# Altium schematic sheet ADC.SchDoc: ADC
size A4; DocumentNumber: 5; SheetNumber: 6; SheetTotal: 16
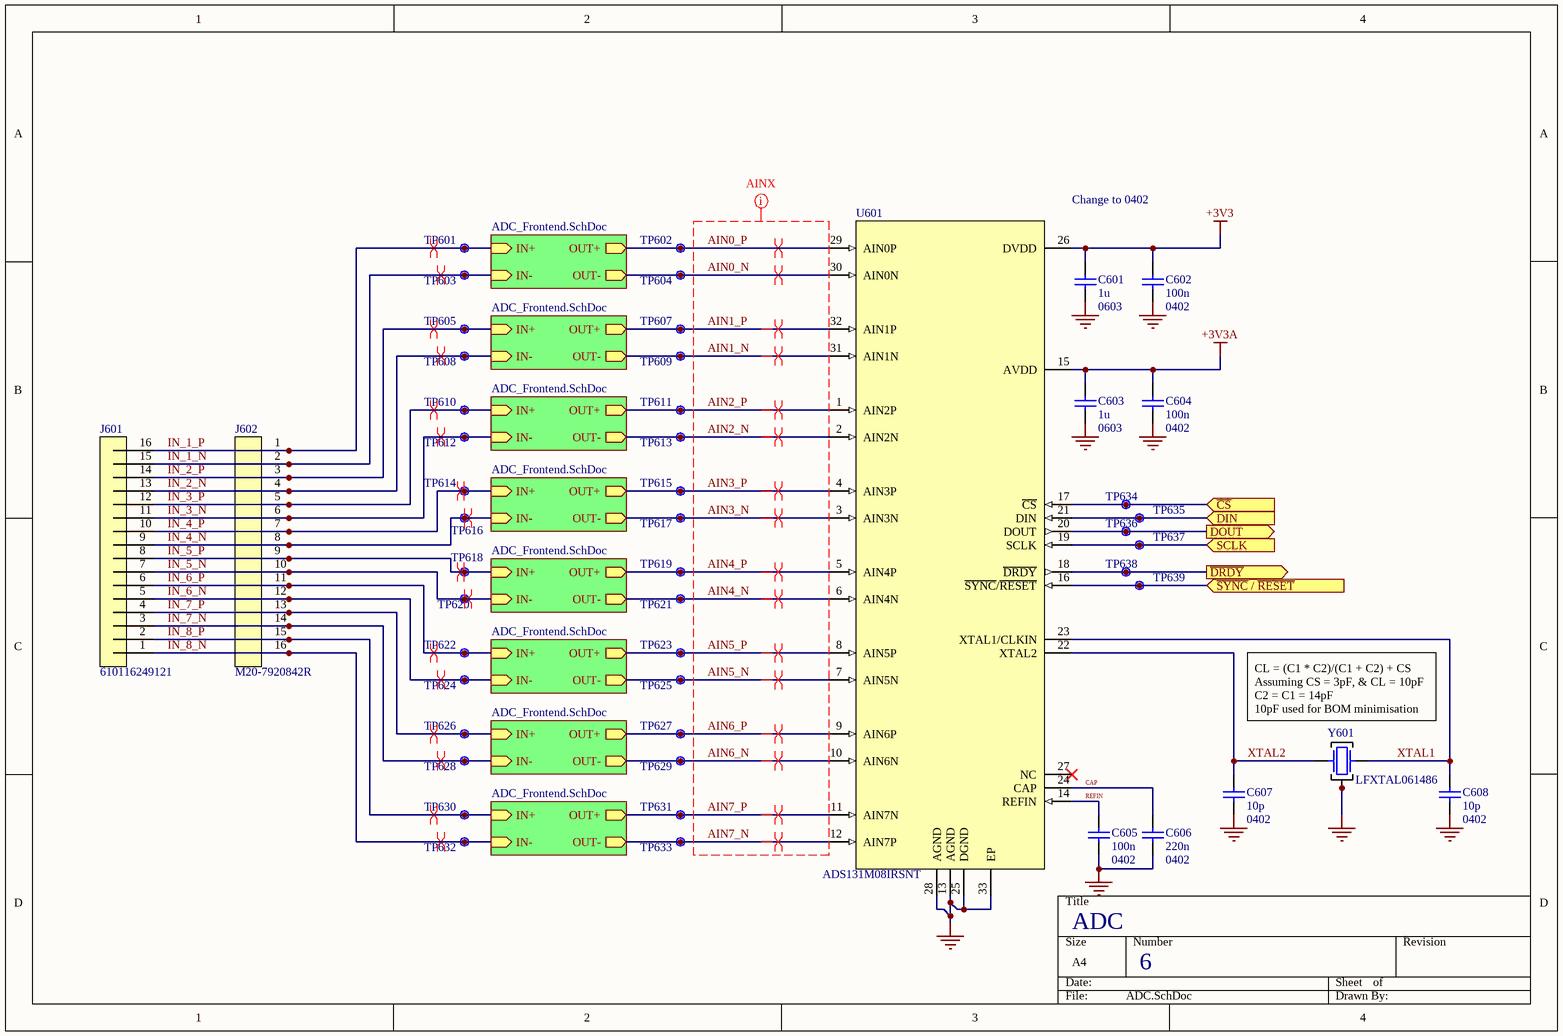
[diagram p0: ADC.SchDoc]

## Parts
C601  1u  Footprint: 0603  [CAP_0603_B]
C602  100n  Footprint: 0402  [CAP_0402_B]
C603  1u  Footprint: 0603  [CAP_0603_B]
C604  100n  Footprint: 0402  [CAP_0402_B]
C605  100n  Footprint: 0402  [CAP_0402_B]
C606  220n  Footprint: 0402  [CAP_0402_B]
C607  10p  Footprint: 0402  [CAP_0402_B]
C608  10p  Footprint: 0402  [CAP_0402_B]
J601  610116249121  [610116249121]
J602  M20-7920842R  [M20-7920842R]
TP601  Net  [Unlabelled Testpoint]  (value not drawn)
TP602  Net  [Unlabelled Testpoint]  (value not drawn)
TP603  Net  [Unlabelled Testpoint]  (value not drawn)
TP604  Net  [Unlabelled Testpoint]  (value not drawn)
TP605  Net  [Unlabelled Testpoint]  (value not drawn)
TP607  Net  [Unlabelled Testpoint]  (value not drawn)
TP608  Net  [Unlabelled Testpoint]  (value not drawn)
TP609  Net  [Unlabelled Testpoint]  (value not drawn)
TP610  Net  [Unlabelled Testpoint]  (value not drawn)
TP611  Net  [Unlabelled Testpoint]  (value not drawn)
TP612  Net  [Unlabelled Testpoint]  (value not drawn)
TP613  Net  [Unlabelled Testpoint]  (value not drawn)
TP614  Net  [Unlabelled Testpoint]  (value not drawn)
TP615  Net  [Unlabelled Testpoint]  (value not drawn)
TP616  Net  [Unlabelled Testpoint]  (value not drawn)
TP617  Net  [Unlabelled Testpoint]  (value not drawn)
TP618  Net  [Unlabelled Testpoint]  (value not drawn)
TP619  Net  [Unlabelled Testpoint]  (value not drawn)
TP620  Net  [Unlabelled Testpoint]  (value not drawn)
TP621  Net  [Unlabelled Testpoint]  (value not drawn)
TP622  Net  [Unlabelled Testpoint]  (value not drawn)
TP623  Net  [Unlabelled Testpoint]  (value not drawn)
TP624  Net  [Unlabelled Testpoint]  (value not drawn)
TP625  Net  [Unlabelled Testpoint]  (value not drawn)
TP626  Net  [Unlabelled Testpoint]  (value not drawn)
TP627  Net  [Unlabelled Testpoint]  (value not drawn)
TP628  Net  [Unlabelled Testpoint]  (value not drawn)
TP629  Net  [Unlabelled Testpoint]  (value not drawn)
TP630  Net  [Unlabelled Testpoint]  (value not drawn)
TP631  Net  [Unlabelled Testpoint]  (value not drawn)
TP632  Net  [Unlabelled Testpoint]  (value not drawn)
TP633  Net  [Unlabelled Testpoint]  (value not drawn)
TP634  Net  [Unlabelled Testpoint]  (value not drawn)
TP635  Net  [Unlabelled Testpoint]  (value not drawn)
TP636  Net  [Unlabelled Testpoint]  (value not drawn)
TP637  Net  [Unlabelled Testpoint]  (value not drawn)
TP638  Net  [Unlabelled Testpoint]  (value not drawn)
TP639  Net  [Unlabelled Testpoint]  (value not drawn)
U601  ADS131M08IRSNT  [ADS131M08IRSNT]
Y601  LFXTAL061486  [LFXTAL061486]

## Sub-sheets
ADC_Frontend = ADC_Frontend.SchDoc: IN+ (in), OUT+ (out), OUT- (out), IN- (in)
ADC_Frontend = ADC_Frontend.SchDoc: IN+ (in), OUT+ (out), OUT- (out), IN- (in)
ADC_Frontend = ADC_Frontend.SchDoc: IN+ (in), OUT+ (out), OUT- (out), IN- (in)
ADC_Frontend = ADC_Frontend.SchDoc: IN+ (in), OUT+ (out), OUT- (out), IN- (in)
ADC_Frontend = ADC_Frontend.SchDoc: IN+ (in), OUT+ (out), OUT- (out), IN- (in)
ADC_Frontend = ADC_Frontend.SchDoc: IN+ (in), OUT+ (out), OUT- (out), IN- (in)
ADC_Frontend = ADC_Frontend.SchDoc: IN+ (in), OUT+ (out), OUT- (out), IN- (in)
CH0 = ADC_Frontend.SchDoc: IN+ (in), OUT+ (out), OUT- (out), IN- (in)

## Ports
DIN (in, see Top_Level[2C]), DOUT (out, see Top_Level[2C]), SCLK (in, see Top_Level[2C]), ~{CS} (in, see Top_Level[2C]), ~{DRDY} (out, see Top_Level[2C]), ~{SYNC} / ~{RESET} (in, see Top_Level[2C])

## Nets
+3V3: C601.1 C602.1 U601.26(DVDD)
+3V3A: C603.1 C604.1 U601.15(AVDD)
GND: C601.2 C602.2 C603.2 C604.2 C605.2 C606.2 C607.2 C608.2 U601.13(AGND) U601.25(DGND) U601.28(AGND) U601.33(EP) Y601.2(GND) Y601.4(GND)
AIN0_N: TP604.1 U601.30(AIN0N) ; sheet CH0/OUT-
AIN0_P: TP602.1 U601.29(AIN0P) ; sheet CH0/OUT+
AIN1_N: TP609.1 U601.31(AIN1N) ; sheet ADC_Frontend/OUT-
AIN1_P: TP607.1 U601.32(AIN1P) ; sheet ADC_Frontend/OUT+
AIN2_N: TP613.1 U601.2(AIN2N) ; sheet ADC_Frontend/OUT-
AIN2_P: TP611.1 U601.1(AIN2P) ; sheet ADC_Frontend/OUT+
AIN3_N: TP617.1 U601.3(AIN3N) ; sheet ADC_Frontend/OUT-
AIN3_P: TP615.1 U601.4(AIN3P) ; sheet ADC_Frontend/OUT+
AIN4_N: TP621.1 U601.6(AIN4N) ; sheet ADC_Frontend/OUT-
AIN4_P: TP619.1 U601.5(AIN4P) ; sheet ADC_Frontend/OUT+
AIN5_N: TP625.1 U601.7(AIN5N) ; sheet ADC_Frontend/OUT-
AIN5_P: TP623.1 U601.8(AIN5P) ; sheet ADC_Frontend/OUT+
AIN6_N: TP629.1 U601.10(AIN6N) ; sheet ADC_Frontend/OUT-
AIN6_P: TP627.1 U601.9(AIN6P) ; sheet ADC_Frontend/OUT+
AIN7_N: TP633.1 U601.12(AIN7P) ; sheet ADC_Frontend/OUT-
AIN7_P: TP631.1 U601.11(AIN7N) ; sheet ADC_Frontend/OUT+
~{CS}: TP634.1 U601.17(~{CS}) ; port ~{CS}
CAP: C606.1 U601.24(CAP)
~{DRDY}: TP638.1 U601.18(~{DRDY}) ; port ~{DRDY}
DIN: TP635.1 U601.21(DIN) ; port DIN
DOUT: TP636.1 U601.20(DOUT) ; port DOUT
IN_1_N: J601.15 J602.2 TP603.1 ; sheet CH0/IN-
IN_1_P: J601.16 J602.1 TP601.1 ; sheet CH0/IN+
IN_2_N: J601.13 J602.4 TP608.1 ; sheet ADC_Frontend/IN-
IN_2_P: J601.14 J602.3 TP605.1 ; sheet ADC_Frontend/IN+
IN_3_N: J601.11 J602.6 TP612.1 ; sheet ADC_Frontend/IN-
IN_3_P: J601.12 J602.5 TP610.1 ; sheet ADC_Frontend/IN+
IN_4_N: J601.9 J602.8 TP616.1 ; sheet ADC_Frontend/IN-
IN_4_P: J601.10 J602.7 TP614.1 ; sheet ADC_Frontend/IN+
IN_5_N: J601.7 J602.10 TP620.1 ; sheet ADC_Frontend/IN-
IN_5_P: J601.8 J602.9 TP618.1 ; sheet ADC_Frontend/IN+
IN_6_N: J601.5 J602.12 TP624.1 ; sheet ADC_Frontend/IN-
IN_6_P: J601.6 J602.11 TP622.1 ; sheet ADC_Frontend/IN+
IN_7_N: J601.3 J602.14 TP628.1 ; sheet ADC_Frontend/IN-
IN_7_P: J601.4 J602.13 TP626.1 ; sheet ADC_Frontend/IN+
IN_8_N: J601.1 J602.16 TP632.1 ; sheet ADC_Frontend/IN-
IN_8_P: J601.2 J602.15 TP630.1 ; sheet ADC_Frontend/IN+
REFIN: C605.1 U601.14(REFIN)
~{SYNC} / ~{RESET}: TP639.1 U601.16(~{SYNC}/~{RESET}) ; port ~{SYNC} / ~{RESET}
SCLK: TP637.1 U601.19(SCLK) ; port SCLK
XTAL1: C608.1 U601.23(XTAL1/CLKIN) Y601.1(IO)
XTAL2: C607.1 U601.22(XTAL2) Y601.3(IO)

Not connected (* = marked no-connect by the designer): U601 27(NC)*

## Layout directives
differential pair: AIN0_N, AIN0_P, AIN1_N, AIN1_P, AIN2_N, AIN2_P, AIN3_N, AIN3_P, AIN4_N, AIN4_P, AIN5_N, AIN5_P, AIN6_N, AIN6_P, AIN7_N, AIN7_P, IN_1_N, IN_1_P, IN_2_N, IN_2_P, IN_3_N, IN_3_P, IN_4_N, IN_4_P, IN_5_N, IN_5_P, IN_6_N, IN_6_P, IN_7_N, IN_7_P, IN_8_N, IN_8_P
net class AINX: AIN0_N, AIN0_P, AIN1_N, AIN1_P, AIN2_N, AIN2_P, AIN3_N, AIN3_P, AIN4_N, AIN4_P, AIN5_N, AIN5_P, AIN6_N, AIN6_P, AIN7_N, AIN7_P

## Notes on the sheet
- Change to 0402
- (near Y601) CL = (C1 * C2)/(C1 + C2) + CS
  Assuming CS = 3pF, & CL = 10pF
  C2 = C1 = 14pF
  10pF used for BOM minimisation

## Library data of the parts
C601 C603 = CAP_0603: 0603 SMD Capacitor
C602 C604-C608 = CAP_0402: 0402 SMD Capacitor
J601 = 610116249121: Connector Header Surface Mount, Right Angle 16 position 0.100" (2.54mm); Supplier 1: DigiKey; Supplier Part Number 1: 732-6072-6-ND
J602 = M20-7920842R: 16 Position Receptacle Connector 0.100" (2.54mm) Surface Mount, Right Angle Gold; Supplier 1: DigiKey; Supplier Part Number 1: 952-3179-1-ND
TP601-TP605 TP607-TP639 = Unlabelled Testpoint: Symbol for an unlabelled testpoint
U601 = ADS131M08IRSNT: 24 Bit Analog to Digital Converter 8 Input 8 Sigma-Delta 32-QFN (4x4); Supplier 1: DigiKey; Supplier Part Number 1: 296-ADS131M08IRSNTCT-ND
Y601 = LFXTAL061486: 8.192 MHz ±30ppm Crystal 10pF 150 Ohms 4-SMD, No Lead; Supplier 1: DigiKey; Supplier Part Number 1: 1923-LFXTAL061486CT-ND